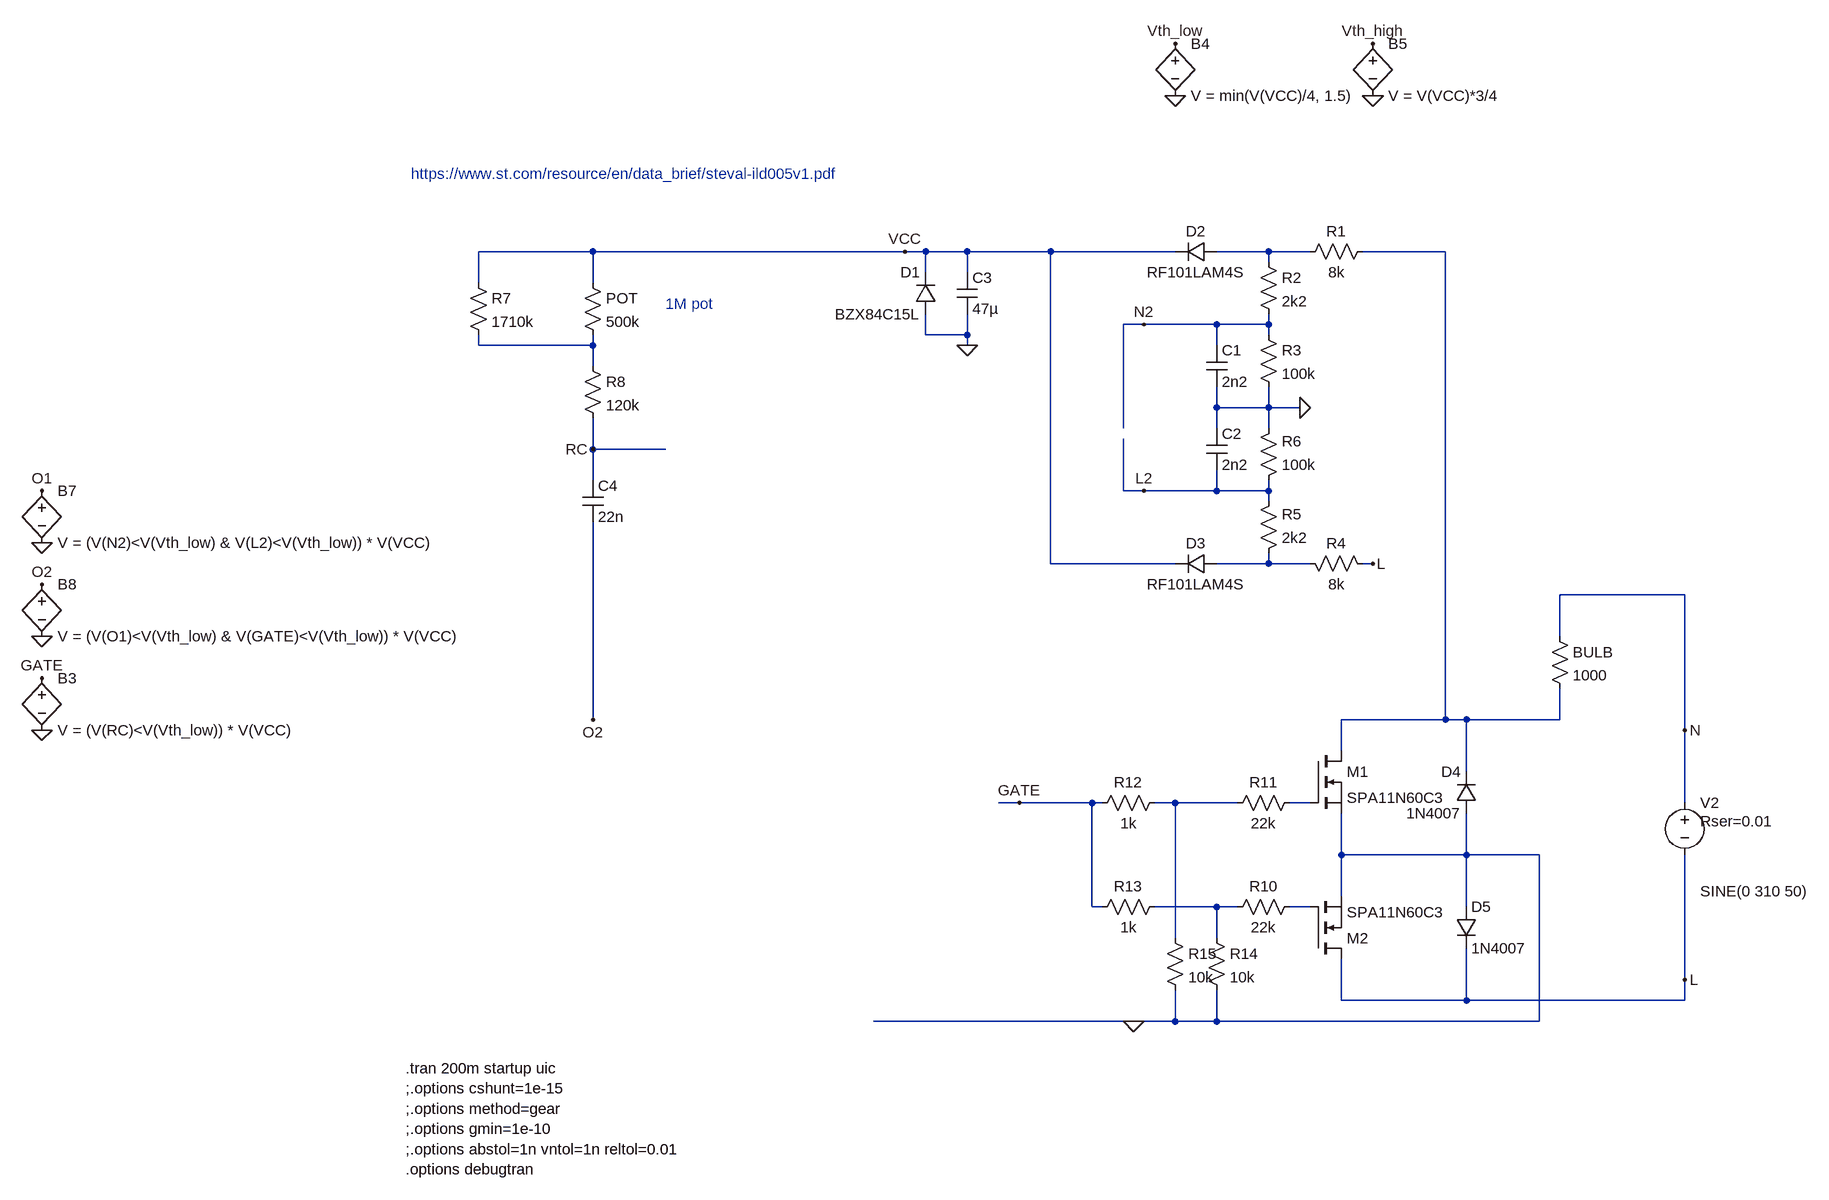
[diagram p0: schematic dimmer_trailing_edge_cd4025_bv.asc]
dimmer_trailing_edge_cd4025_bv.asc, the LTspice schematic file:
Version 4.1
SHEET 1 2496 1136
WIRE 560 -688 384 -688
WIRE 1040 -688 560 -688
WIRE 1072 -688 1040 -688
WIRE 1136 -688 1072 -688
WIRE 1264 -688 1136 -688
WIRE 1456 -688 1264 -688
WIRE 1600 -688 1520 -688
WIRE 1664 -688 1600 -688
WIRE 1872 -688 1744 -688
WIRE 1600 -672 1600 -688
WIRE 1072 -656 1072 -688
WIRE 1136 -656 1136 -688
WIRE 384 -640 384 -688
WIRE 560 -640 560 -688
WIRE 1408 -576 1376 -576
WIRE 1520 -576 1408 -576
WIRE 1600 -576 1600 -592
WIRE 1600 -576 1520 -576
WIRE 1072 -560 1072 -592
WIRE 1136 -560 1136 -592
WIRE 1136 -560 1072 -560
WIRE 1600 -560 1600 -576
WIRE 384 -544 384 -560
WIRE 560 -544 560 -560
WIRE 560 -544 384 -544
WIRE 1136 -544 1136 -560
WIRE 1520 -544 1520 -576
WIRE 560 -512 560 -544
WIRE 1520 -448 1520 -480
WIRE 1600 -448 1600 -480
WIRE 1600 -448 1520 -448
WIRE 1648 -448 1600 -448
WIRE 1376 -416 1376 -576
WIRE 1520 -416 1520 -448
WIRE 1600 -416 1600 -448
WIRE 560 -384 560 -432
WIRE 672 -384 560 -384
WIRE 560 -336 560 -384
WIRE 1376 -320 1376 -400
WIRE 1408 -320 1376 -320
WIRE 1520 -320 1520 -352
WIRE 1520 -320 1408 -320
WIRE 1600 -320 1600 -336
WIRE 1600 -320 1520 -320
WIRE 1600 -304 1600 -320
WIRE 1264 -208 1264 -688
WIRE 1456 -208 1264 -208
WIRE 1600 -208 1600 -224
WIRE 1600 -208 1520 -208
WIRE 1664 -208 1600 -208
WIRE 1760 -208 1744 -208
WIRE 2240 -160 2048 -160
WIRE 2048 -96 2048 -160
WIRE 560 32 560 -272
WIRE 1872 32 1872 -688
WIRE 1872 32 1712 32
WIRE 1904 32 1872 32
WIRE 2048 32 2048 -16
WIRE 2048 32 1904 32
WIRE 2240 48 2240 -160
WIRE 1712 80 1712 32
WIRE 1904 112 1904 32
WIRE 1216 160 1184 160
WIRE 1328 160 1216 160
WIRE 1344 160 1328 160
WIRE 1456 160 1424 160
WIRE 1552 160 1456 160
WIRE 1664 160 1632 160
WIRE 2240 160 2240 48
WIRE 1712 240 1712 176
WIRE 1904 240 1904 176
WIRE 1904 240 1712 240
WIRE 2016 240 1904 240
WIRE 1712 304 1712 240
WIRE 1328 320 1328 160
WIRE 1344 320 1328 320
WIRE 1520 320 1424 320
WIRE 1552 320 1520 320
WIRE 1664 320 1632 320
WIRE 1904 320 1904 240
WIRE 1456 368 1456 160
WIRE 1520 368 1520 320
WIRE 2240 432 2240 240
WIRE 1712 464 1712 400
WIRE 1904 464 1904 384
WIRE 1904 464 1712 464
WIRE 2240 464 2240 432
WIRE 2240 464 1904 464
WIRE 1392 496 992 496
WIRE 1456 496 1456 448
WIRE 1456 496 1392 496
WIRE 1520 496 1520 448
WIRE 1520 496 1456 496
WIRE 2016 496 2016 240
WIRE 2016 496 1520 496
FLAG 2240 48 N
FLAG 2240 432 L
FLAG 1216 160 GATE
FLAG 1136 -544 0
FLAG 1040 -688 VCC
FLAG 1392 496 0
FLAG 1648 -448 0
FLAG 1760 -208 L
FLAG 560 -384 RC
FLAG 1408 -320 L2
FLAG 1408 -576 N2
FLAG 1456 -928 0
FLAG 1456 -1008 Vth_low
FLAG 1760 -928 0
FLAG 1760 -1008 Vth_high
FLAG -288 -240 0
FLAG -288 -320 O1
FLAG -288 -96 0
FLAG -288 -176 O2
FLAG -288 48 0
FLAG -288 -32 GATE
FLAG 560 32 O2
SYMBOL nmos 1664 80 R0
SYMATTR InstName M1
SYMATTR Value SPA11N60C3
SYMBOL nmos 1664 400 M180
SYMATTR InstName M2
SYMATTR Value SPA11N60C3
SYMBOL voltage 2240 144 R0
WINDOW 3 24 152 Left 2
WINDOW 123 24 124 Left 2
WINDOW 39 24 44 Left 2
SYMATTR Value SINE(0 310 50)
SYMATTR SpiceLine Rser=0.01
SYMATTR InstName V2
SYMBOL res 2032 -112 R0
SYMATTR InstName BULB
SYMATTR Value 1000
SYMBOL cap 1120 -656 R0
SYMATTR InstName C3
SYMATTR Value 47µ
SYMBOL res 1648 304 R90
WINDOW 0 0 56 VBottom 2
WINDOW 3 32 56 VTop 2
SYMATTR InstName R10
SYMATTR Value 22k
SYMBOL res 1648 144 R90
WINDOW 0 0 56 VBottom 2
WINDOW 3 32 56 VTop 2
SYMATTR InstName R11
SYMATTR Value 22k
SYMBOL res 1440 144 R90
WINDOW 0 0 56 VBottom 2
WINDOW 3 32 56 VTop 2
SYMATTR InstName R12
SYMATTR Value 1k
SYMBOL res 1440 304 R90
WINDOW 0 0 56 VBottom 2
WINDOW 3 32 56 VTop 2
SYMATTR InstName R13
SYMATTR Value 1k
SYMBOL res 1504 352 R0
SYMATTR InstName R14
SYMATTR Value 10k
SYMBOL res 1440 352 R0
SYMATTR InstName R15
SYMATTR Value 10k
SYMBOL diode 1088 -592 R180
WINDOW 0 24 64 Left 2
WINDOW 3 24 0 Left 2
SYMATTR InstName D1
SYMATTR Value BZX84C15L
SYMATTR Description Diode
SYMATTR Type diode
SYMBOL diode 1520 -704 R90
WINDOW 0 0 32 VBottom 2
WINDOW 3 32 32 VTop 2
SYMATTR InstName D2
SYMATTR Value RF101LAM4S
SYMBOL res 1760 -704 R90
WINDOW 0 0 56 VBottom 2
WINDOW 3 32 56 VTop 2
SYMATTR InstName R1
SYMATTR Value 8k
SYMBOL res 1584 -688 R0
SYMATTR InstName R2
SYMATTR Value 2k2
SYMBOL res 1584 -576 R0
SYMATTR InstName R3
SYMATTR Value 100k
SYMBOL cap 1504 -544 R0
SYMATTR InstName C1
SYMATTR Value 2n2
SYMBOL diode 1520 -192 M270
WINDOW 0 32 32 VTop 2
WINDOW 3 0 32 VBottom 2
SYMATTR InstName D3
SYMATTR Value RF101LAM4S
SYMBOL res 1760 -192 M270
WINDOW 0 32 56 VTop 2
WINDOW 3 0 56 VBottom 2
SYMATTR InstName R4
SYMATTR Value 8k
SYMBOL res 1584 -208 M180
WINDOW 0 36 76 Left 2
WINDOW 3 36 40 Left 2
SYMATTR InstName R5
SYMATTR Value 2k2
SYMBOL res 1584 -320 M180
WINDOW 0 36 76 Left 2
WINDOW 3 36 40 Left 2
SYMATTR InstName R6
SYMATTR Value 100k
SYMBOL cap 1504 -352 M180
WINDOW 0 24 56 Left 2
WINDOW 3 24 8 Left 2
SYMATTR InstName C2
SYMATTR Value 2n2
SYMBOL diode 1920 176 R180
WINDOW 0 24 64 Left 2
WINDOW 3 24 0 Left 2
SYMATTR InstName D4
SYMATTR Value 1N4007
SYMBOL diode 1888 320 R0
SYMATTR InstName D5
SYMATTR Value 1N4007
SYMBOL res 544 -656 R0
SYMATTR InstName POT
SYMATTR Value 500k
SYMBOL res 368 -656 R0
SYMATTR InstName R7
SYMATTR Value 1710k
SYMBOL res 544 -528 R0
SYMATTR InstName R8
SYMATTR Value 120k
SYMBOL cap 544 -336 R0
SYMATTR InstName C4
SYMATTR Value 22n
SYMBOL bv 1456 -1024 R0
SYMATTR InstName B4
SYMATTR Value V = min(V(VCC)/4, 1.5)
SYMBOL bv 1760 -1024 R0
SYMATTR InstName B5
SYMATTR Value V = V(VCC)*3/4
SYMBOL bv -288 -336 R0
SYMATTR InstName B7
SYMATTR Value V = (V(N2)<V(Vth_low) & V(L2)<V(Vth_low)) * V(VCC)
SYMBOL bv -288 -192 R0
SYMATTR InstName B8
SYMATTR Value V = (V(O1)<V(Vth_low) & V(GATE)<V(Vth_low)) * V(VCC)
SYMBOL bv -288 -48 R0
SYMATTR InstName B3
SYMATTR Value V = (V(RC)<V(Vth_low)) * V(VCC)
TEXT 280 -808 Left 2 ;https://www.st.com/resource/en/data_brief/steval-ild005v1.pdf
TEXT 272 568 Left 2 !.tran 200m startup uic\n;.options cshunt=1e-15\n;.options method=gear\n;.options gmin=1e-10\n;.options abstol=1n vntol=1n reltol=0.01\n.options debugtran
TEXT 672 -608 Left 2 ;1M pot

The netlist it stands for:
* dimmer_trailing_edge_cd4025_bv.asc
M1 N002 N006 0 0 SPA11N60C3
M2 L N008 0 0 SPA11N60C3
V2 N L SINE(0 310 50) Rser=0.01
R§BULB N N002 1000
C3 VCC 0 47µ
R10 N008 N007 22k
R11 N006 N005 22k
R12 N005 GATE 1k
R13 N007 GATE 1k
R14 N007 0 10k
R15 N005 0 10k
D1 0 VCC BZX84C15L
D2 N001 VCC RF101LAM4S
R1 N002 N001 8k
R2 N001 N2 2k2
R3 N2 0 100k
C1 N2 0 2n2
D3 N004 VCC RF101LAM4S
R4 L N004 8k
R5 N004 L2 2k2
R6 L2 0 100k
C2 L2 0 2n2
D4 0 N002 1N4007
D5 0 L 1N4007
R§POT VCC N003 500k
R7 VCC N003 1710k
R8 N003 RC 120k
C4 RC O2 22n
B4 Vth_low 0 V = min(V(VCC)/4, 1.5)
B5 Vth_high 0 V = V(VCC)*3/4
B7 O1 0 V = (V(N2)<V(Vth_low) & V(L2)<V(Vth_low)) * V(VCC)
B8 O2 0 V = (V(O1)<V(Vth_low) & V(GATE)<V(Vth_low)) * V(VCC)
B3 GATE 0 V = (V(RC)<V(Vth_low)) * V(VCC)
.model D D
.lib standard.dio
.model NMOS NMOS
.model PMOS PMOS
.lib standard.mos
* https://www.st.com/resource/en/data_brief/steval-ild005v1.pdf
.tran 200m startup uic
;.options cshunt=1e-15
;.options method=gear
;.options gmin=1e-10
;.options abstol=1n vntol=1n reltol=0.01
.options debugtran
* 1M pot
.backanno
.end